# EAGLE design DevKitC_LED_DRIVER_V14 (EAGLE 9.6.2)
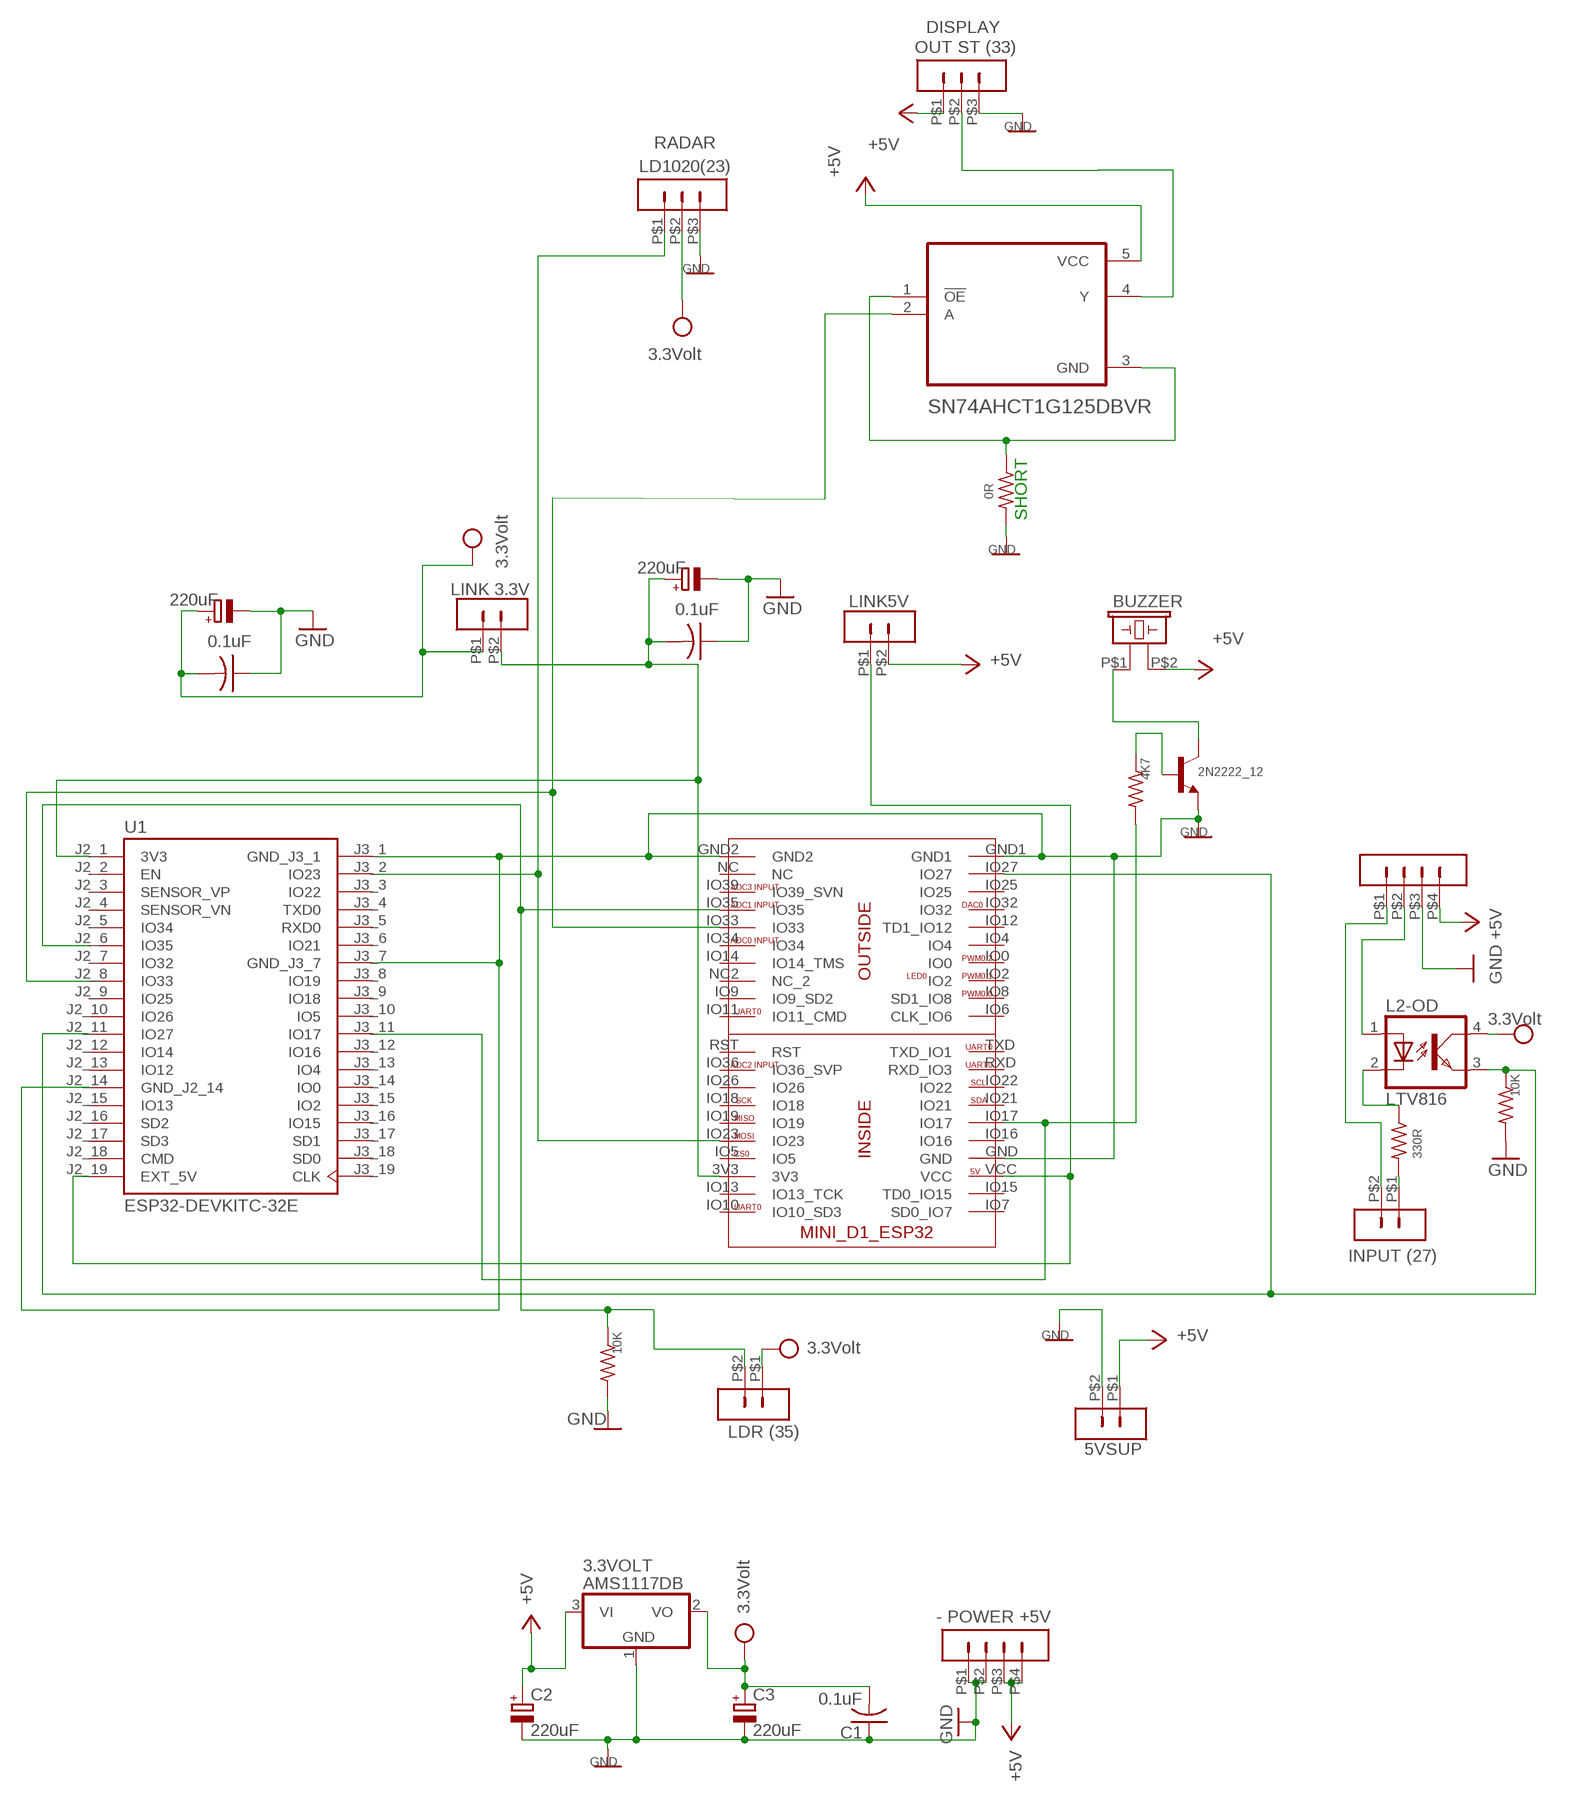
[diagram p0: schematic, sheet 1]

## Parts
2N2222_12  2N2222  2N3904  [TO92]
3.3VOLT  AMS1117DB  [SOT223]
5VSUP  5VSUP  2WAYHEADERSTRIP2WAYHP  [2WAYNORMAL]
BUZZER  BUZZER (17)  BUZZERDONUT  [F/CM12P_2]
C1  0.1uF  C-US050-025X075  [C050-025X075]
C2  220uF  CPOL-EUE2.5-7  [E2,5-7]
C3  220uF  CPOL-EUE2.5-7  [E2,5-7]
C4  0.1uF  C-US050-025X075  [C050-025X075]
C5  0.1uF  C-US050-025X075  [C050-025X075]
C6  220uF  CPOL-EUE2.5-7  [E2,5-7]
C7  220uF  CPOL-EUE2.5-7  [E2,5-7]
L2-OD  LTV816  [DIL04]
LD1020  LD1020(23)  3WAYHEADERSTRIPNARROW  [3WAY_SH_NARROW]
LINK3.3V  LDR (35)  2WAYHEADERSTRIPNARROW  [2WAY_SH_NARROW]
LINK5V  LINK5V  2WAYHEADERSTRIP2WAYHP  [2WAYNORMAL]
OUT_DISPLAY  OUT ST (33)  3WAYHEADERSTRIPNARROW  [3WAY_SH_NARROW]
R3  330R  R-US_R0805  [R0805]
R4  10K  R-US_R0805  [R0805]
R7  10K  R-US_R0805  [R0805]
R11  0R  R-US_R0805  [R0805]
R48  4K7  R-US_R0805  [R0805]
U1  ESP32-DEVKITC-32E  [MODULE_ESP32-DEVKITC-32E]
U4  SN74AHCT1G125DBVR  [SOT95P280X145-5N]
U$1  WEMOS_DI_MINI_ESP32_2  [WEMOS_MINI_D1_ESP32_2]
U$2  - POWER +5V  4WAYHEADERSTRIPNARROW  [4WAY_SH_NARROW]
U$6  INPUT (27)  2WAYHEADERSTRIPNARROW  [2WAY_SH_NARROW]
U$15  LINK 3.3V  2WAYHEADERSTRIP2WAYHP  [2WAYNORMAL]
U$18  4WAYHEADERSTRIPJUMBER  [4WAY_JUMBER]

## Nets
+5V [12V]: 3.3VOLT.3(VI) 5VSUP.P$1 BUZZER.P$2 C2.+ LINK5V.P$2 OUT_DISPLAY.P$1 U4.5(VCC) U$2.P$3 U$2.P$4 U$18.P$4
GND [GND]: 2N2222_12.3(E) 3.3VOLT.1(GND) 5VSUP.P$2 C1.1 C2.- C3.- C4.1 C5.1 C6.- C7.- LD1020.P$3 OUT_DISPLAY.P$3 R4.2 R7.2 R11.2 U1.J2_14(GND_J2_14) U1.J3_1(GND_J3_1) U1.J3_7(GND_J3_7) U$1.GND U$1.GND1 U$1.GND2 U$2.P$1 U$2.P$2 U$18.P$3
N$2: 2N2222_12.2(B) R48.1
N$3: R48.2 U1.J3_11(IO17) U$1.IO17
N$4: R3.2 U$6.P$1
N$5: L2-OD.2(C) R3.1
N$16: U1.J2_8(IO33) U4.2(A) U$1.IO33
N$17: OUT_DISPLAY.P$2 U4.4(Y)
N$27: L2-OD.3(EMIT) R7.1 U1.J2_11(IO27) U$1.IO27
N$33: LINK3.3V.P$2 R4.1 U1.J2_6(IO35) U$1.IO35
N$34 [3V]: C5.2 C6.+ U1.J2_1(3V3) U$1.3V3 U$15.P$2
N$38: 2N2222_12.1(C) BUZZER.P$1
N$43 [12mil]: R11.1 U4.1(!OE) U4.3(GND)
N$48 [GND]: U$6.P$2 U$18.P$1
N$50: LD1020.P$1 U1.J3_2(IO23) U$1.IO23
N$51 [12V]: L2-OD.1(A) U$18.P$2
N$52 [POWER]: LINK5V.P$1 U1.J2_19(EXT_5V) U$1.VCC
VCC [3V]: 3.3VOLT.2(VO) C1.2 C3.+ C4.2 C7.+ L2-OD.4(COL) LD1020.P$2 LINK3.3V.P$1 U$15.P$1
Unconnected: U1.J2_2(EN) U1.J2_3(SENSOR_VP) U1.J2_4(SENSOR_VN) U1.J2_5(IO34) U1.J2_7(IO32) U1.J2_9(IO25) U1.J2_10(IO26) U1.J2_12(IO14) U1.J2_13(IO12) U1.J2_15(IO13) U1.J2_16(SD2) U1.J2_17(SD3) U1.J2_18(CMD) U1.J3_3(IO22) U1.J3_4(TXD0) U1.J3_5(RXD0) U1.J3_6(IO21) U1.J3_8(IO19) U1.J3_9(IO18) U1.J3_10(IO5) U1.J3_12(IO16) U1.J3_13(IO4) U1.J3_14(IO0) U1.J3_15(IO2) U1.J3_16(IO15) U1.J3_17(SD1) U1.J3_18(SD0) U1.J3_19(CLK) U$1.IO0 U$1.IO2 U$1.IO4 U$1.IO5 U$1.IO6(CLK_IO6) U$1.IO7(SD0_IO7) U$1.IO8(SD1_IO8) U$1.IO9(IO9_SD2) U$1.IO10(IO10_SD3) U$1.IO11(IO11_CMD) U$1.IO12(TD1_IO12) U$1.IO13(IO13_TCK) U$1.IO14(IO14_TMS) U$1.IO15(TD0_IO15) U$1.IO16 U$1.IO18 U$1.IO19 U$1.IO21 U$1.IO22 U$1.IO25 U$1.IO26 U$1.IO32 U$1.IO34 U$1.IO36(IO36_SVP) U$1.IO39(IO39_SVN) U$1.NC U$1.NC2(NC_2) U$1.RST U$1.RXD(RXD_IO3) U$1.TXD(TXD_IO1)

## Notes on the sheet
- DISPLAY
- RADAR
- SHORT

## Library data of the parts
2N2222_12 = transistor:2N3904: NPN TRANSISTOR
3.3VOLT = BDV_01:AMS1117: 250 mA, 16V, Low Quiescent Current LDO Regulator Source: http://ww1.microchip.com/downloads/en/DeviceDoc/22049b.pdf
5VSUP LINK3.3V LINK5V U$6 U$15 = BDV_02:2WAYHEADERSTRIP: Narrow
BUZZER = BDV_01:BUZZER
C1 C4 C5 = adafruit:C-US: CAPACITOR, American symbol
C2 C3 C6 C7 = resistor:CPOL-EU: POLARIZED CAPACITOR, European symbol
L2-OD = optocoupler:LTV816: OPTO COUPLER Source: LITEON, LTV816.pdf; OC_FARNELL: unknown; OC_NEWARK: unknown
LD1020 OUT_DISPLAY = BDV_02:3WAYHEADERSTRIP: 3Way Connect
R3 R4 R7 R11 R48 = resistor:R-US_: RESISTOR, American symbol
U1 = ESP32-DEVKITC-32E:ESP32-DEVKITC-32E: Check availability <https://pricing.snapeda.com/parts/ESP32-DEVKITC-32E/Espressif%20Systems/view-part?ref=eda>; AVAILABILITY: In Stock; CHECK_PRICES: https://www.snapeda.com/parts/ESP32-DEVKITC-32E/Espressif+Systems/view-part/?ref=eda; DESCRIPTION: The ESP32-DEVKITC-32E transceiver evaluation board from Espressif Systems is a powerful development tool for wireless communication technologies. It supports 802.11 b/g/n Wi-Fi and Bluetooth® Smart Ready 4.x (BLE) dual-mode at 2.4GHz, making it ideal for a variety of IoT applications. Equipped with a PCB antenna and 4MB flash, this board provides reliable connectivity and ample memory for developing and testing RF, RFID, and wireless solutions.; MF: Espressif Systems; MP: ESP32-DEVKITC-32E; PACKAGE: None; PRICE: None; SNAPEDA_LINK: https://www.snapeda.com/parts/ESP32-DEVKITC-32E/Espressif+Systems/view-part/?ref=snap
U4 = SN74AHCT1G125DBVR:SN74AHCT1G125DBVR: Check availability <https://pricing.snapeda.com/parts/SN74AHCT1G125DBVR/Texas%20Instruments/view-part?ref=eda>; AVAILABILITY: In Stock; CHECK_PRICES: https://www.snapeda.com/parts/SN74AHCT1G125DBVR/Texas+Instruments/view-part/?ref=eda; DESCRIPTION: Single 4.5-V to 5.5-V buffer with TTL-compatible CMOS inputs and 3-state outputs; MF: Texas Instruments; MP: SN74AHCT1G125DBVR; PACKAGE: SOT-23-5 Texas Instruments; PRICE: None; SNAPEDA_LINK: https://www.snapeda.com/parts/SN74AHCT1G125DBVR/Texas+Instruments/view-part/?ref=snap
U$1 = BDV_02:WEMOS_DI_MINI_ESP32_2: WEMOS_MINI
U$2 U$18 = BDV_02:4WAYHEADERSTRIP: normal FAT PADS Jumber

## Net classes
0 default: width 0.4 mm, drill 0.305 mm, clearance 0.305 mm
1 POWER: width 1.2 mm, drill 0.305 mm, clearance 0.305 mm to class 0, clearance 0.305 mm
2 12V: width 1 mm, drill 0.305 mm, clearance 0.305 mm to class 0, clearance 0.305 mm to class 1, clearance 0.305 mm
3 ground: width 1 mm, drill 0.305 mm, clearance 0.305 mm to class 0, clearance 0.305 mm to class 1, clearance 0.305 mm to class 2, clearance 0.305 mm
4 3V: width 1 mm, drill 0.305 mm, clearance 0.305 mm to class 0, clearance 0.305 mm to class 1, clearance 0.305 mm to class 2, clearance 0.305 mm to class 3, clearance 0.305 mm
5 GND: width 1 mm, drill 0.305 mm, clearance 0.305 mm to class 0, clearance 0.305 mm to class 1, clearance 0.305 mm to class 2, clearance 0.305 mm to class 3, clearance 0.305 mm to class 4, clearance 0.305 mm
6 12mil: width 0.305 mm

## Board
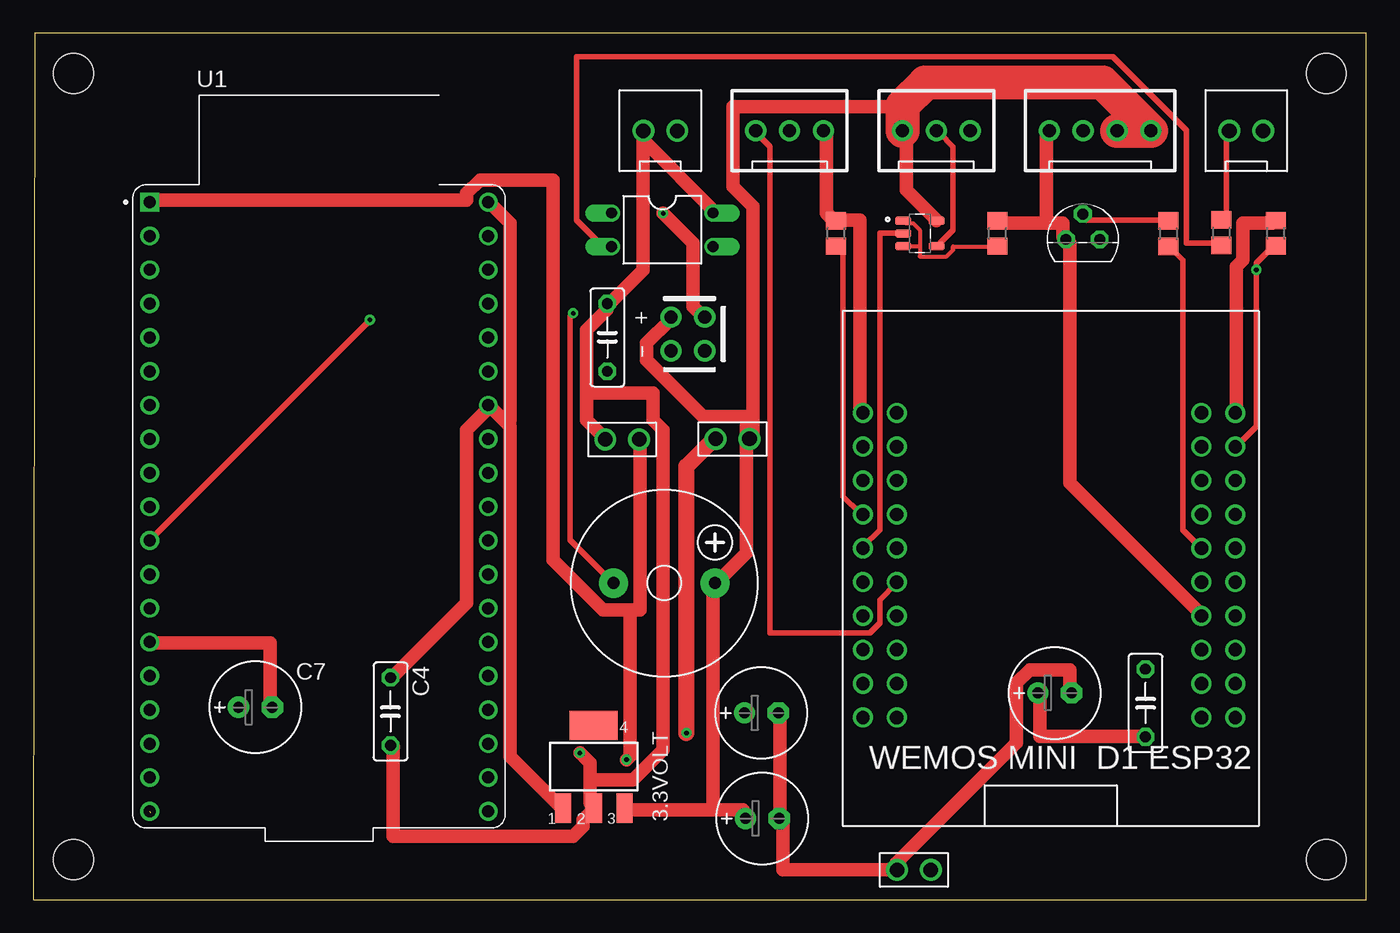
[diagram p1: board, top side]
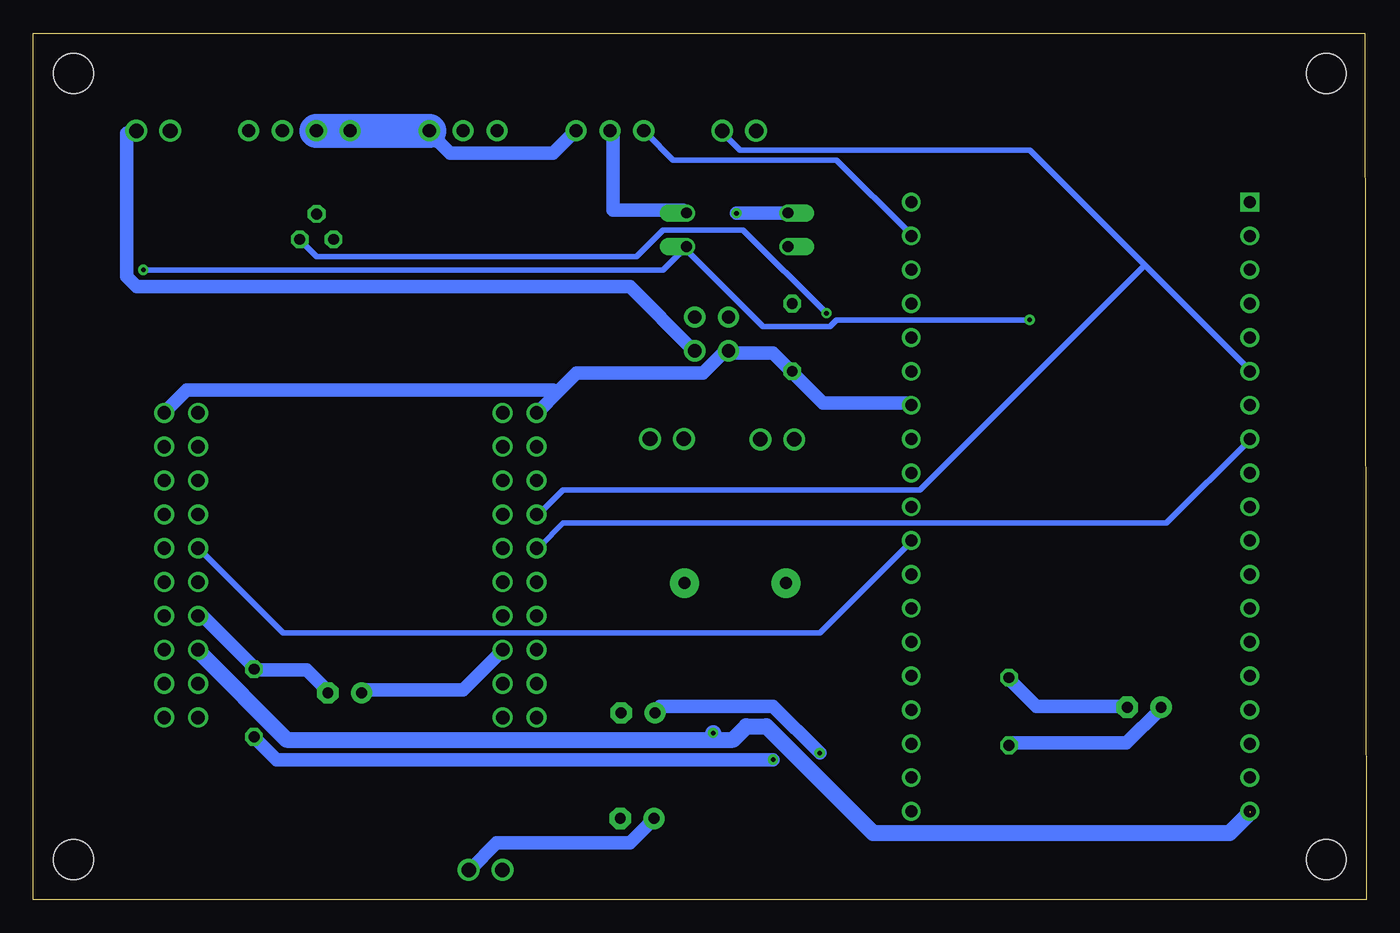
[diagram p2: board, bottom side, seen from below]

Size 100 x 65 mm. Coordinates in mm from the lower left corner, seen from the top.
Outline: 0,0 100,0 100,65 0.1,65 0,0
Copper layers (1*16): Top 0.035mm / dielectric 1.5mm / Bottom 0.035mm
Design rules "default *": minimum track width 6mil, minimum drill 0.35mm, track to track 6mil, track to pad 6mil, pad to pad 6mil, via to via 6mil, smd to smd 6mil, copper to edge 40mil, drill to drill 6mil, minimum pad ring 10mil, minimum via ring 8mil, stop-mask expansion 4mil, vias tented up to drill 20mil, thermal gap 10mil
Holes 3 mm at 3,62 3,3 97,3 97,62

### Footprints (pad centres in the part's own frame; a part is rotated, then mirrored left to right if it is on the bottom)
TO92 = drill 0.813 octagon: 1 1.27,0; 2 0,1.905; 3 -1.27,0
SOT223 = smd 1.219 x 2.235: 1 -2.311,-3.099; 2 0,-3.099; 3 2.311,-3.099 | smd 3.6 x 2.2: 4 0,3.099
2WAYNORMAL = drill 1.092: P$1 -1.27,0; P$2 1.27,0
F/CM12P_2 = drill 0.9 pad 2.184: P$1 -3.81,0; P$2 3.81,0
C050-025X075 = drill 0.813 octagon: 1 -2.54,0; 2 2.54,0
E2,5-7 = drill 0.813 pad 1.6: + -1.27,0 | drill 0.813 pad 1.6 octagon: - 1.27,0
DIL04 = drill 0.813 offset: 1 -1.27,-3.81; 2 1.27,-3.81; 3 1.27,3.81; 4 -1.27,3.81
3WAY_SH_NARROW = drill 1 pad 1.6: P$1 -6.35,0; P$2 -3.81,0; P$3 -1.27,0
2WAY_SH_NARROW = drill 1.092: P$1 -1.27,0; P$2 1.27,0
R0805 = smd 1.3 x 1.5: 1 -0.95,0; 2 0.95,0
MODULE_ESP32-DEVKITC-32E = drill 0.9 square: J2_1 -12.7,22.835 | drill 0.9: J2_2 -12.7,20.295; J2_3 -12.7,17.755; J2_4 -12.7,15.215; J2_5 -12.7,12.675; J2_6 -12.7,10.135; J2_7 -12.7,7.595; J2_8 -12.7,5.055; J2_9 -12.7,2.515; J2_10 -12.7,-0.025; J2_11 -12.7,-2.565; J2_12 -12.7,-5.105; J2_13 -12.7,-7.645; J2_14 -12.7,-10.185; J2_15 -12.7,-12.725; J2_16 -12.7,-15.265; J2_17 -12.7,-17.805; J2_18 -12.7,-20.345; J2_19 -12.7,-22.885; J3_1 12.7,22.835; J3_2 12.7,20.295; J3_3 12.7,17.755; J3_4 12.7,15.215; J3_5 12.7,12.675; J3_6 12.7,10.135; J3_7 12.7,7.595; J3_8 12.7,5.055; J3_9 12.7,2.515; J3_10 12.7,-0.025; J3_11 12.7,-2.565; J3_12 12.7,-5.105; J3_13 12.7,-7.645; J3_14 12.7,-10.185; J3_15 12.7,-12.725; J3_16 12.7,-15.265; J3_17 12.7,-17.805; J3_18 12.7,-20.345; J3_19 12.7,-22.885
SOT95P280X145-5N = smd 1.21 x 0.59: 1 -1.255,0.95; 2 -1.255,0; 3 -1.255,-0.95; 4 1.255,-0.95; 5 1.255,0.95
WEMOS_MINI_D1_ESP32_2 = drill 1: 3V3 -11.43,-7.62; GND -13.97,10.16; GND1 11.43,-5.08; GND2 13.97,10.16; IO0 13.97,-5.08; IO2 13.97,-7.62; IO4 13.97,-2.54; IO5 -11.43,-5.08; IO6 13.97,-12.7; IO7 11.43,-12.7; IO8 13.97,-10.16; IO9 -13.97,-10.16; IO10 -11.43,-12.7; IO11 -13.97,-12.7; IO12 13.97,0; IO13 -11.43,-10.16; IO14 -13.97,-5.08; IO15 11.43,-10.16; IO16 11.43,-2.54; IO17 11.43,0; IO18 -11.43,2.54; IO19 -11.43,0; IO21 11.43,2.54; IO22 11.43,5.08; IO23 -11.43,-2.54; IO25 13.97,5.08; IO26 -11.43,5.08; IO27 13.97,7.62; IO32 13.97,2.54; IO33 -13.97,0; IO34 -13.97,-2.54; IO35 -13.97,2.54; IO36 -11.43,7.62; IO39 -13.97,5.08; NC -13.97,7.62; NC2 -13.97,-7.62; RST -11.43,10.16; RXD 11.43,7.62; TXD 11.43,10.16; VCC 11.43,-7.62
4WAY_SH_NARROW = drill 1 pad 1.6: P$1 -3.81,0; P$2 -1.27,0; P$3 1.27,0; P$4 3.81,0
4WAY_JUMBER = drill 1 pad 1.6: P$1 -1.27,-1.27; P$2 1.27,-1.27; P$3 -1.27,1.27; P$4 1.27,1.27

### Placement (x,y rotation side)
2N2222_12  78.74,49.54 0 top
3.3VOLT  42.05,9.97 0 top
5VSUP  66.07,2.22 180 top
BUZZER  47.34,23.74 0 top
C1  43.07,42.18 90 top
C2  54.7,6.08 0 top
C3  54.63,14.01 0 top
C4  26.8,14.11 270 top
C5  83.44,14.75 270 top
C6  76.63,15.5 0 top
C7  16.66,14.43 0 top
L2-OD  47.19,50.25 270 top
LD1020  60.55,57.69 0 top
LINK3.3V  47.04,57.69 0 top
LINK5V  52.46,34.56 0 top
OUT_DISPLAY  71.56,57.69 0 top
R3  89.15,50.04 90 top
R4  60.23,49.98 90 top
R7  93.23,50 90 top
R11  72.33,49.98 90 top
R48  85.15,49.96 270 top
U1  21.43,29.5 0 top
U4  66.52,49.98 0 top
U$1  76.21,26.36 0 top
U$2  80.04,57.69 0 top
U$6  91,57.69 0 top
U$15  44.18,34.53 0 top
U$18  49.11,42.44 90 top

### Tracks (layer width: path | path; a pad name or v marks a point on that pad's centre or on a via)
+5V
  Top 1: 51,6.75 53.25,6.75 53.25,6.25 C2.+ | 51,6.75 44.5,6.75 3.3VOLT.3 | U4.5 67.75,51 65.5,53.25 65.5,56.5 OUT_DISPLAY.P$1 | U$18.P$4 47.75,43.5 46,41.75 46,40.5 50.25,36.25 53.5,36.25 53.5,34.75 LINK5V.P$2 | 65.21,59.5 52.5,59.5 52.5,53.5 54,52 54,34.75 LINK5V.P$2 | LINK5V.P$2 53.5,34.25 53.5,26 51.25,23.75 BUZZER.P$2 51,23.25 51,6.75
  Top 2.54: U$2.P$3 U$2.P$4 80.23,61.31 66.93,61.31 65.21,59.59 65.21,59.5 OUT_DISPLAY.P$1
  Bottom 1: 5VSUP.P$1 67.25,2.25 65.25,4.25 55.25,4.25 53.5,6 C2.+
GND
  Top 1: C3.- 56,14 56,6.25 C2.- 56.25,5.75 56.25,2.25 64.75,2.25 5VSUP.P$2 64.75,2.75 73.75,11.75 73.75,16.25 74.75,17.25 77.75,17.25 77.75,15.75 C6.- | LD1020.P$3 59.5,57.5 59.5,51.5 60,51 R4.2 60.75,51 62,51 62,36.75 U$1.GND | 76,50.75 77.25,50.75 77.25,49.75 2N2222_12.3 77.75,49.25 77.75,31.25 87.5,21.5 U$1.GND1 | 76,50.75 72.5,50.75 R11.2 | 76,50.75 76,57.5 U$2.P$1 | R7.2 93,50.75 90.75,50.75 90.75,48 90.25,47.5 90.25,36.75 U$1.GND2 | U1.J2_14 8.75,19.25 17.75,19.25 17.75,14.5 C7.- | 35.5,35.75 34.25,37 U1.J3_7 34,36.75 32.5,35.25 32.5,22.25 27,16.75 C4.1 | 35.5,35.75 35.75,35.5 35.75,10.75 39.5,7 3.3VOLT.1 | U1.J3_1 34.25,52.25 35.75,50.75 35.75,36 35.5,35.75
  Bottom 1: U$1.GND1 87.5,21.25 87.25,21.25 83.5,17.5 C5.1 83,17.25 79.5,17.25 78,15.75 C6.- | LD1020.P$3 59.5,57.5 61,56 68.75,56 69.5,56.75 OUT_DISPLAY.P$3 | 60.75,38 59.25,39.5 49.75,39.5 48.25,41 U$18.P$3 47.75,41 44.5,41 43.25,39.75 C1.1 42.75,39.25 40.75,37.25 34.25,37.25 U1.J3_7 | 60.75,38 62,36.75 U$1.GND | U$1.GND2 90,36.75 88.5,38.25 61,38.25 60.75,38 | C4.1 26.75,16.5 24.75,14.5 18,14.5 C7.-
  Bottom 2.54: U$2.P$2 U$2.P$1 OUT_DISPLAY.P$3
N$2
  Top 0.4: R48.1 85,51 78.75,51 78.75,51.25 2N2222_12.2
N$3
  Top 0.4: U$1.IO17 86.25,27.75 86.25,48 85.25,49 R48.2
  Bottom 0.4: U1.J3_11 34.25,26.75 41,20 81.25,20 87.5,26.25 U$1.IO17
N$4
  Top 0.4: R3.2 89.25,51 89.5,51.25 89.5,57.5 U$6.P$1
N$5
  Top 0.4: R3.1 89,49.25 86.5,49.25 86.5,57.75 81,63.25 40.75,63.25 40.75,51 42.75,49 43.25,49 L2-OD.2
N$16
  Top 0.4: U4.2 65.25,50 63.5,50 63.5,27.75 62.25,26.5 U$1.IO33
  Bottom 0.4: U1.J2_8 8.75,34.5 15,28.25 60.25,28.25 62,26.5 U$1.IO33
N$17
  Top 0.4: U4.4 68,49.25 69,50.25 69,56.5 68,57.5 OUT_DISPLAY.P$2
N$27  (via drill 0.35)
  Top 0.4: R7.1 93,49 91.75,47.75 v91.75,47.25 91.75,35.5 90.25,34 U$1.IO27 | v25.25,43.5 8.75,27 U1.J2_11
  Bottom 0.4: v91.75,47.25 52.75,47.25 51.25,48.75 L2-OD.3 51,48.75 45.25,43 40.25,43 39.75,43.5 v25.25,43.5
N$33
  Top 0.4: R4.1 60.25,49 60.75,48.5 60.75,30.25 62,29 U$1.IO35
  Bottom 0.4: 16.62,47.62 25.25,56.25 47,56.25 48.25,57.5 LINK3.3V.P$2 | 16.62,47.62 8.75,39.75 U1.J2_6 | 16.62,47.62 33.5,30.75 60.25,30.75 62,29 U$1.IO35
N$34  (via drill 0.35)
  Top 1: C5.2 83.25,12.25 75.5,12.25 75.5,15.5 C6.+ | 44.75,21.75 45.5,21.75 45.5,34.5 U$15.P$2 | 44.75,21.75 42.75,21.75 39,25.5 39,54 33.5,54 32.5,53 32.5,52.5 8.75,52.5 U1.J2_1 | v44.5,10.5 44.75,10.75 44.75,21.75
  Bottom 1: U$1.3V3 65,18.5 67.75,15.75 75.25,15.75 C6.+ | v44.5,10.5 81.75,10.5 83.25,12 C5.2
N$38  (via drill 0.35)
  Top 0.4: v40.5,44 40.25,43.75 40.25,27 43.5,23.75 BUZZER.P$1
  Bottom 0.4: v40.5,44 46.75,50.25 52.75,50.25 54.75,48.25 78.75,48.25 80,49.5 2N2222_12.1
N$43
  Top 0.305: 66.5,49 65.5,49 U4.3 | 66.5,49 66.5,50.25 66,50.75 65.5,50.75 U4.1 | 66.5,49 66.5,48.25 68.5,48.25 69,48.75 69,49 72.25,49 R11.1
N$48
  Bottom 1: U$18.P$1 50.5,41.25 55.25,46 92.25,46 93,46.75 93,57.5 92.5,57.5 U$6.P$2
N$50
  Top 0.4: U$1.IO23 64.75,23.75 63.5,22.5 63.5,20.75 62.75,20 55.25,20 55.25,56.5 54.25,57.5 LD1020.P$1
  Bottom 0.4: U1.J3_2 34.25,50 39.75,55.5 52,55.5 54,57.5 LD1020.P$1
N$51  (via drill 0.35)
  Top 1: v47.25,51.5 49.5,49.25 49.5,44.5 50.25,43.75 U$18.P$2
  Bottom 1: v47.25,51.5 43.5,51.5 L2-OD.1
N$52  (via drill 0.35)  (1 unrouted)
  Top 1.2: v49,12.5 49,32.5 51,34.5 LINK5V.P$1
  Bottom 1.2: 8.75,6.5 10.25,5 37,5 45,13 46.5,13 47.5,12 49,12 | 49,12 81,12 87.5,18.5 U$1.VCC | v49,12.5 49,12
VCC  (via drill 0.35)
  Top 1: 45.75,56.75 45.75,57.5 LINK3.3V.P$1 | 45.75,56.75 45.75,47.25 43.25,44.75 C1.2 43,44.25 41.5,42.75 41.5,38 | L2-OD.4 51,51.75 46,56.75 45.75,56.75 | 41.5,38 41.5,36 42.75,34.75 U$15.P$1 | C4.2 27,11.5 27,4.75 40.5,4.75 41.25,5.5 41.25,6 42,6.75 3.3VOLT.2 41.75,7.25 41.75,9 | v41,11 41.75,10.25 41.75,9 | 41.5,38 46.5,38 46.5,36 47.25,35.25 47.25,11.25 45,9 41.75,9
  Bottom 1: LD1020.P$2 56.5,57.5 56.5,51.75 51.25,51.75 L2-OD.4 | C7.+ 15.5,14.25 18,11.75 26.75,11.75 C4.2 | v41,11 44.5,14.5 53,14.5 53.25,14.25 C3.+

### Text on the board
tValues: + | IN | + | RADAR | - | + | OUT | - | - | + | 1 | + | DevKitC-32E - ESP32 LED DISPLAY - 23/05/2026 V14 | + | --